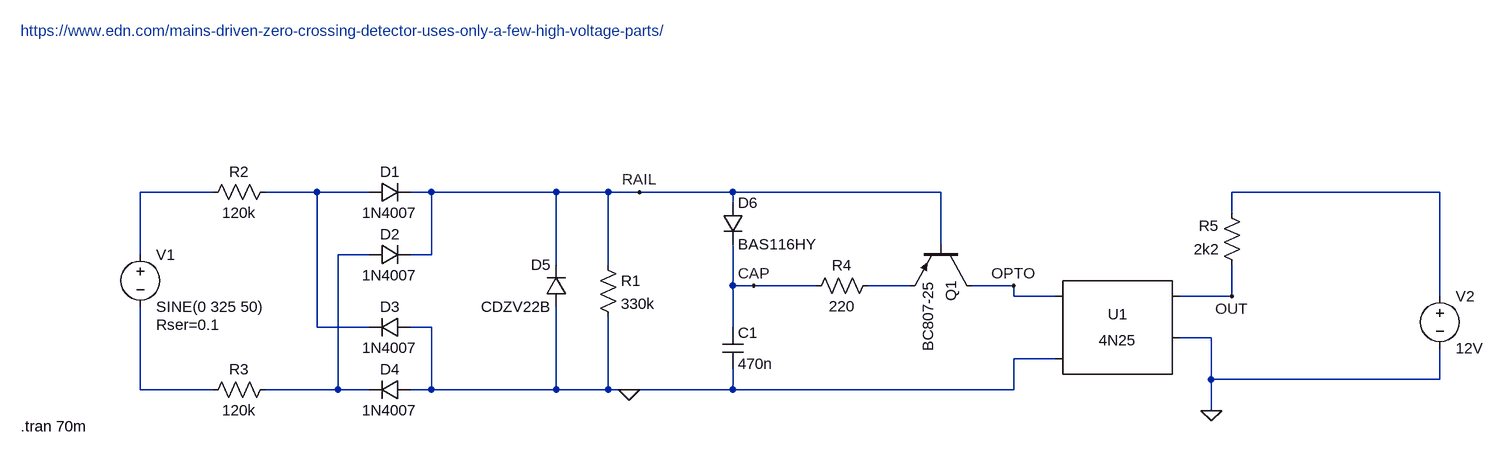
[diagram p0: schematic zero_crossing_EDN.asc]
zero_crossing_EDN.asc, the LTspice schematic file:
Version 4.1
SHEET 1 2200 680
WIRE 240 272 128 272
WIRE 400 272 320 272
WIRE 480 272 400 272
WIRE 576 272 544 272
WIRE 768 272 576 272
WIRE 848 272 768 272
WIRE 896 272 848 272
WIRE 1040 272 896 272
WIRE 1360 272 1040 272
WIRE 2128 272 1808 272
WIRE 1040 288 1040 272
WIRE 1808 304 1808 272
WIRE 1360 352 1360 272
WIRE 128 368 128 272
WIRE 480 368 432 368
WIRE 576 368 576 272
WIRE 576 368 544 368
WIRE 768 384 768 272
WIRE 848 384 848 272
WIRE 1040 416 1040 352
WIRE 1072 416 1040 416
WIRE 1168 416 1072 416
WIRE 1312 416 1248 416
WIRE 1472 416 1408 416
WIRE 1472 432 1472 416
WIRE 1536 432 1472 432
WIRE 1808 432 1808 384
WIRE 1808 432 1728 432
WIRE 2128 432 2128 272
WIRE 400 480 400 272
WIRE 480 480 400 480
WIRE 576 480 544 480
WIRE 1040 480 1040 416
WIRE 1776 496 1728 496
WIRE 1536 528 1472 528
WIRE 1776 560 1776 496
WIRE 2128 560 2128 512
WIRE 2128 560 1776 560
WIRE 128 576 128 448
WIRE 240 576 128 576
WIRE 432 576 432 368
WIRE 432 576 320 576
WIRE 480 576 432 576
WIRE 576 576 576 480
WIRE 576 576 544 576
WIRE 768 576 768 448
WIRE 768 576 576 576
WIRE 848 576 848 464
WIRE 848 576 768 576
WIRE 880 576 848 576
WIRE 1040 576 1040 544
WIRE 1040 576 880 576
WIRE 1472 576 1472 528
WIRE 1472 576 1040 576
WIRE 1776 608 1776 560
FLAG 1776 608 0
FLAG 880 576 0
FLAG 1808 432 OUT
FLAG 896 272 RAIL
FLAG 1072 416 CAP
FLAG 1472 416 OPTO
SYMBOL diode 480 288 R270
WINDOW 0 32 32 VTop 2
WINDOW 3 0 32 VBottom 2
SYMATTR InstName D1
SYMATTR Value 1N4007
SYMBOL diode 480 384 R270
WINDOW 0 32 32 VTop 2
WINDOW 3 0 32 VBottom 2
SYMATTR InstName D2
SYMATTR Value 1N4007
SYMBOL diode 544 464 R90
WINDOW 0 0 32 VBottom 2
WINDOW 3 32 32 VTop 2
SYMATTR InstName D3
SYMATTR Value 1N4007
SYMBOL diode 544 560 R90
WINDOW 0 0 32 VBottom 2
WINDOW 3 32 32 VTop 2
SYMATTR InstName D4
SYMATTR Value 1N4007
SYMBOL voltage 128 352 R0
WINDOW 123 0 0 Left 0
WINDOW 39 24 124 Left 2
SYMATTR InstName V1
SYMATTR Value SINE(0 325 50)
SYMATTR SpiceLine Rser=0.1
SYMBOL res 832 368 R0
SYMATTR InstName R1
SYMATTR Value 330k
SYMBOL res 336 256 R90
WINDOW 0 0 56 VBottom 2
WINDOW 3 32 56 VTop 2
SYMATTR InstName R2
SYMATTR Value 120k
SYMBOL res 336 560 R90
WINDOW 0 0 56 VBottom 2
WINDOW 3 32 56 VTop 2
SYMATTR InstName R3
SYMATTR Value 120k
SYMBOL res 1264 400 R90
WINDOW 0 0 56 VBottom 2
WINDOW 3 32 56 VTop 2
SYMATTR InstName R4
SYMATTR Value 220
SYMBOL res 1824 400 R180
WINDOW 0 36 76 Left 2
WINDOW 3 36 40 Left 2
SYMATTR InstName R5
SYMATTR Value 2k2
SYMBOL Optos\\4N25 1632 496 R0
SYMATTR InstName U1
SYMBOL diode 784 448 R180
WINDOW 0 24 64 Left 2
WINDOW 3 24 0 Left 2
SYMATTR InstName D5
SYMATTR Value CDZV22B
SYMATTR Description Diode
SYMATTR Type diode
SYMBOL diode 1024 288 R0
SYMATTR InstName D6
SYMATTR Value BAS116HY
SYMBOL cap 1024 480 R0
SYMATTR InstName C1
SYMATTR Value 470n
SYMBOL pnp 1408 352 R90
SYMATTR InstName Q1
SYMATTR Value BC807-25
SYMBOL voltage 2128 416 R0
WINDOW 123 0 0 Left 0
WINDOW 39 0 0 Left 0
SYMATTR InstName V2
SYMATTR Value 12V
TEXT -56 24 Left 2 ;https://www.edn.com/mains-driven-zero-crossing-detector-uses-only-a-few-high-voltage-parts/
TEXT -56 632 Left 2 !.tran 70m

The netlist it stands for:
* zero_crossing_EDN.asc
D1 N002 RAIL 1N4007
D2 N004 RAIL 1N4007
D3 0 N002 1N4007
D4 0 N004 1N4007
V1 N001 N006 SINE(0 325 50) Rser=0.1
R1 RAIL 0 330k
R2 N002 N001 120k
R3 N004 N006 120k
R4 N005 CAP 220
R5 OUT N003 2k2
X§U1 OPTO 0 OUT 0 NC_01 4N25
D5 0 RAIL CDZV22B
D6 RAIL CAP BAS116HY
C1 CAP 0 470n
Q1 OPTO RAIL N005 0 BC807-25
V2 N003 0 12V
.model D D
.lib standard.dio
.model NPN NPN
.model PNP PNP
.lib standard.bjt
* https://www.edn.com/mains-driven-zero-crossing-detector-uses-only-a-few-high-voltage-parts/
.tran 70m
.lib 4N25.sub
.backanno
.end